# Altium schematic sheet Analog_Project_Mixer_output.SchDoc
size A4; SheetNumber: 1; SheetTotal: 1
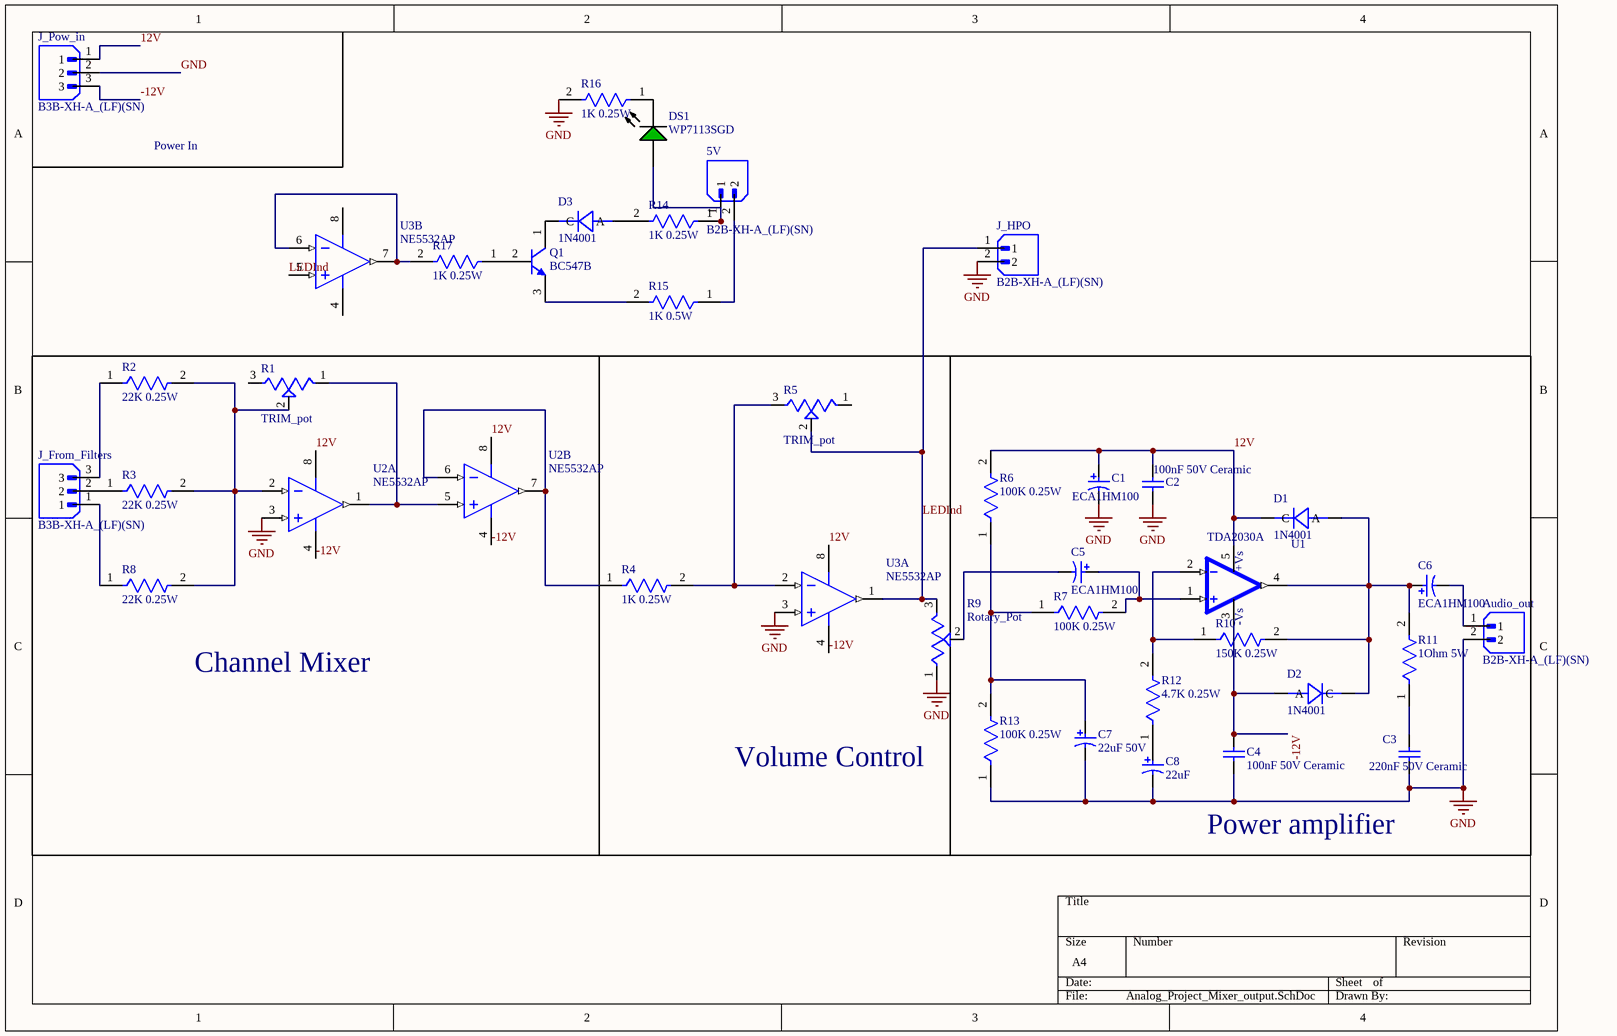
[diagram p0: Analog_Project_Mixer_output.SchDoc]

## Parts
5V  B2B-XH-A_(LF)(SN)  [JST_B2B-XH-A_(LF)(SN)]
Audio_out  B2B-XH-A_(LF)(SN)  [JST_B2B-XH-A_(LF)(SN)]
C1  ECA1HM100  [10uF 25V]
C2  100nF 50V Ceramic  [100nF Cap]
C3  220nF 50V Ceramic  [100nF Cap]
C4  100nF 50V Ceramic  [100nF Cap]
C5  ECA1HM100  [10uF 25V]
C6  ECA1HM100  [10uF 25V]
C7  22uF 50V  [10uF 25V]
C8  22uF  [10uF 25V]
D1  1N4001  [1N400X]
D2  1N4001  [1N400X]
D3  1N4001  [1N400X]
DS1  WP7113SGD  [KING-WP7113SGD_V]
J_From_Filters  B3B-XH-A_(LF)(SN)  [JST_B3B-XH-A (LF)(SN)]
J_HPO  B2B-XH-A_(LF)(SN)  [JST_B2B-XH-A_(LF)(SN)]
J_Pow_in  B3B-XH-A_(LF)(SN)  [JST_B3B-XH-A (LF)(SN)]
Q1  BC547B  [BC547B]
R1  TRIM_pot  [TRIM_Pot]
R2  22K 0.25W  [0.25W Carbon film]
R3  22K 0.25W  [0.25W Carbon film]
R4  1K 0.25W  [0.50W Carbon film]
R5  TRIM_pot  [TRIM_Pot]
R6  100K 0.25W  [0.25W Carbon film]
R7  100K 0.25W  [0.25W Carbon film]
R8  22K 0.25W  [0.25W Carbon film]
R9  Rotary_Pot  [Rotary_pot]
R10  150K 0.25W  [0.25W Carbon film]
R11  1Ohm 5W  [0.5W resistor]
R12  4.7K 0.25W  [0.50W Carbon film]
R13  100K 0.25W  [0.25W Carbon film]
R14  1K 0.25W  [0.25W Carbon film]
R15  1K 0.5W  [0.25W Carbon film]
R16  1K 0.25W  [0.25W Carbon film]
R17  1K 0.25W  [0.25W Carbon film]
U1  TDA2030A  [TDA2030A]
U2  NE5532AP  [NE5532]  (parts A,B of 2)
U3  NE5532AP  [NE5532]  (parts A,B of 2)

## Nets
GND: Audio_out.2 C1.2 C2.1 C3.1 C4.1 C7.2 C8.2 J_HPO.2 J_Pow_in.2 R9.1 R13.1 R16.2 U2.3(IN1+) U3.3(IN1+)
12V: C1.1 C2.2 D1.C J_Pow_in.1 R6.2 U1.5(+VS) U2.8(VCC+) U3.8(VCC+)
-12V: C4.2 D2.A J_Pow_in.3 U1.3(-VS) U2.4(VCC-) U3.4(VCC-)
LEDInd: J_HPO.1 R5.2(W) R9.3 U3.1(OUT1) U3.5(IN2+)
Net5V_1: 5V.1 DS1.1(A) R14.1
Net5V_2: 5V.2 R15.1
NetAudio_out_1: Audio_out.1 C6.2
NetC3_2: C3.2 R11.1
NetC5_1: C5.1 R7.2 U1.1(NON_INV_IN)
NetC5_2: C5.2 R9.2
NetC6_1: C6.1 D1.A D2.C R10.2 R11.2 U1.4(OUT)
NetC7_1: C7.1 R6.1 R7.1 R13.2
NetC8_1: C8.1 R12.1
NetD3_A: D3.A R14.2
NetD3_C: D3.C Q1.1(C)
NetDS1_2: DS1.2(K) R16.1
NetJ_From_Filters_1: J_From_Filters.1 R8.1
NetJ_From_Filters_2: J_From_Filters.2 R3.1
NetJ_From_Filters_3: J_From_Filters.3 R2.1
NetQ1_2: Q1.2(B) R17.1
NetQ1_3: Q1.3(E) R15.2
NetR1_1: R1.1(CCW) U2.1(OUT1) U2.5(IN2+)
NetR1_2: R1.2(W) R2.2 R3.2 R8.2 U2.2(IN1-)
NetR4_1: R4.1 U2.6(IN2-) U2.7(OUT2)
NetR4_2: R4.2 R5.3(CW) U3.2(IN1-)
NetR10_1: R10.1 R12.2 U1.2(INV_IN)
NetR17_2: R17.2 U3.6(IN2-) U3.7(OUT2)

Not connected (* = marked no-connect by the designer): R1 3(CW); R5 1(CCW)

## Notes on the sheet
- Power In
- Channel Mixer
- Volume Control
- Power amplifier
- (in symbol TDA2030A) +Vs; -Vs

## Library data of the parts
5V Audio_out J_HPO = B2B-XH-A_(LF)(SN): Connector Header Through Hole 2 position 0.098 (2.50mm); MF: JST Sales; MP: B2B-XH-A (LF)(SN); SnapEDA_Link: https://www.snapeda.com/parts/B2B-XH-A%20(LF)(SN)/JST+Sales+America+Inc./view-part/?ref=snap; Package: None; Value: *; Check_prices: https://www.snapeda.com/parts/B2B-XH-A%20(LF)(SN)/JST+Sales+America+Inc./view-part/?ref=eda
C1 = 100uF 25V: Aluminum Electrolytic Capacitor, 10 uF, +/- 20%, 50 V, -40 to 85 degC, 2-Pin THD, RoHS, Bulk; Manufacturer: Panasonic; Life (Hours): 2000Hour; Lead/Base Style: Straight; Dissipation Factor: 0.12%; Capacitance: 10uF; Leakage Current: 3uA; Dielectric Material: Aluminium; Lead Diameter: 0.5mm; Voltage Rating: 50V; Ripple Current: 65mA; Package Reference: CAPPR55-200-1100X500X1200; Height: 11mm; Diameter: 5mm; REACH SVHC: NoSVHC; Mount: ThroughHole; Packaging: Bulk; Manufacturer URL: http://www.panasonic.com/; Termination: Radial; Datasheet URL: https://industrial.panasonic.com/cdbs/www-data/pdf/RDF0000/ABA0000C1218.pdf; Lead Free: LeadFree; Height - Seated (Max): 0.472inch; Case/Package: Radial; Package Description: 2-Pin Radial Lead, Dia 5 mm, Height 12 mm; Tolerance: 20%; Datasheet Version: Rev. 05, 10/2016; Package Quantity: 200; Ripple Current (AC): 65mA; Min Operating Temperature: -40degC; RoHSCompliant: true; Number of Pins: 2; Max Operating Temperature: 85degC; Voltage: 50V; Lead Pitch: 2mm; Radiation Hardening: No; Voltage Rating (DC): 50V; Length: 11mm
C2 C4 = 100nF 50V Ceramic: Ceramic Capacitor, 100 nF, +/- 10%, 50 V, -55 to 125 degC, 2-Pin THD, RoHS, Tape and Reel; Manufacturer: Vishay; Other Names: BC1084CT; Catalog Drawings: Mono-KapSide2-15_5.58Mono-KapSide1_15; Temperature Coefficient: X7R; Online Catalog: Mono-Kap™Series; Capacitance: 0.1µF; Size / Dimension: 0.157"Lx0.098"W(4.00mmx2.50mm); Operating Temperature: -55°C~125°C; Family: CeramicCapacitors; Manufacturer URL: http://www.vishay.com/; Standard Package: 1; Thickness (Max): -; Ratings: -; Datasheet Version: 08/2013; Package Description: 2-Pin Through Hole Device, Body 4 x 2.6 mm; Mounting Type: ThroughHole; Features: -; Lead Spacing: 0.098"(2.50mm); Tolerance: ±10%; Category: Capacitors; Mounting Technology: ThroughHole; Voltage - Rated: 50V; Lead Style: Straight; Datasheet URL: http://www.vishay.com/docs/45171/kseries.pdf; Applications: GeneralPurpose; Package / Case: Radial; Height - Seated (Max): 0.220"(5.58mm); Package Reference: K104K15X7RF5TL2; Series: Mono-Kap™K; Packaging: CutTape(CT)
C3 = 220nF 50V Ceramic: Ceramic Capacitor, 100 nF, +/- 10%, 50 V, -55 to 125 degC, 2-Pin THD, RoHS, Tape and Reel; Manufacturer: Vishay; Other Names: BC1084CT; Catalog Drawings: Mono-KapSide2-15_5.58Mono-KapSide1_15; Temperature Coefficient: X7R; Online Catalog: Mono-Kap™Series; Capacitance: 0.1µF; Size / Dimension: 0.157"Lx0.098"W(4.00mmx2.50mm); Operating Temperature: -55°C~125°C; Family: CeramicCapacitors; Manufacturer URL: http://www.vishay.com/; Standard Package: 1; Thickness (Max): -; Ratings: -; Datasheet Version: 08/2013; Package Description: 2-Pin Through Hole Device, Body 4 x 2.6 mm; Mounting Type: ThroughHole; Features: -; Lead Spacing: 0.098"(2.50mm); Tolerance: ±10%; Category: Capacitors; Mounting Technology: ThroughHole; Voltage - Rated: 50V; Lead Style: Straight; Datasheet URL: http://www.vishay.com/docs/45171/kseries.pdf; Applications: GeneralPurpose; Package / Case: Radial; Height - Seated (Max): 0.220"(5.58mm); Package Reference: K104K15X7RF5TL2; Series: Mono-Kap™K; Packaging: CutTape(CT)
C5 = 1uF 50v electrolytic: Aluminum Electrolytic Capacitor, 10 uF, +/- 20%, 50 V, -40 to 85 degC, 2-Pin THD, RoHS, Bulk; Manufacturer: Panasonic; Life (Hours): 2000Hour; Lead/Base Style: Straight; Dissipation Factor: 0.12%; Capacitance: 10uF; Leakage Current: 3uA; Dielectric Material: Aluminium; Lead Diameter: 0.5mm; Voltage Rating: 50V; Ripple Current: 65mA; Package Reference: CAPPR55-200-1100X500X1200; Height: 11mm; Diameter: 5mm; REACH SVHC: NoSVHC; Mount: ThroughHole; Packaging: Bulk; Manufacturer URL: http://www.panasonic.com/; Termination: Radial; Datasheet URL: https://industrial.panasonic.com/cdbs/www-data/pdf/RDF0000/ABA0000C1218.pdf; Lead Free: LeadFree; Height - Seated (Max): 0.472inch; Case/Package: Radial; Package Description: 2-Pin Radial Lead, Dia 5 mm, Height 12 mm; Tolerance: 20%; Datasheet Version: Rev. 05, 10/2016; Package Quantity: 200; Ripple Current (AC): 65mA; Min Operating Temperature: -40degC; RoHSCompliant: true; Number of Pins: 2; Max Operating Temperature: 85degC; Voltage: 50V; Lead Pitch: 2mm; Radiation Hardening: No; Voltage Rating (DC): 50V; Length: 11mm
C6 = 2000uF 25V: Aluminum Electrolytic Capacitor, 10 uF, +/- 20%, 50 V, -40 to 85 degC, 2-Pin THD, RoHS, Bulk; Manufacturer: Panasonic; Life (Hours): 2000Hour; Lead/Base Style: Straight; Dissipation Factor: 0.12%; Capacitance: 10uF; Leakage Current: 3uA; Dielectric Material: Aluminium; Lead Diameter: 0.5mm; Voltage Rating: 50V; Ripple Current: 65mA; Package Reference: CAPPR55-200-1100X500X1200; Height: 11mm; Diameter: 5mm; REACH SVHC: NoSVHC; Mount: ThroughHole; Packaging: Bulk; Manufacturer URL: http://www.panasonic.com/; Termination: Radial; Datasheet URL: https://industrial.panasonic.com/cdbs/www-data/pdf/RDF0000/ABA0000C1218.pdf; Lead Free: LeadFree; Height - Seated (Max): 0.472inch; Case/Package: Radial; Package Description: 2-Pin Radial Lead, Dia 5 mm, Height 12 mm; Tolerance: 20%; Datasheet Version: Rev. 05, 10/2016; Package Quantity: 200; Ripple Current (AC): 65mA; Min Operating Temperature: -40degC; RoHSCompliant: true; Number of Pins: 2; Max Operating Temperature: 85degC; Voltage: 50V; Lead Pitch: 2mm; Radiation Hardening: No; Voltage Rating (DC): 50V; Length: 11mm
C7 = 22uF 50V: Aluminum Electrolytic Capacitor, 10 uF, +/- 20%, 50 V, -40 to 85 degC, 2-Pin THD, RoHS, Bulk; Manufacturer: Panasonic; Life (Hours): 2000Hour; Lead/Base Style: Straight; Dissipation Factor: 0.12%; Capacitance: 10uF; Leakage Current: 3uA; Dielectric Material: Aluminium; Lead Diameter: 0.5mm; Ripple Current: 65mA; Package Reference: CAPPR55-200-1100X500X1200; Height: 11mm; Diameter: 5mm; REACH SVHC: NoSVHC; Mount: ThroughHole; Packaging: Bulk; Manufacturer URL: http://www.panasonic.com/; Termination: Radial; Datasheet URL: https://industrial.panasonic.com/cdbs/www-data/pdf/RDF0000/ABA0000C1218.pdf; Lead Free: LeadFree; Height - Seated (Max): 0.472inch; Case/Package: Radial; Package Description: 2-Pin Radial Lead, Dia 5 mm, Height 12 mm; Tolerance: 20%; Voltage Rating: 50V; Datasheet Version: Rev. 05, 10/2016; Package Quantity: 200; Ripple Current (AC): 65mA; Min Operating Temperature: -40degC; RoHSCompliant: true; Number of Pins: 2; Max Operating Temperature: 85degC; Voltage: 50V; Lead Pitch: 2mm; Radiation Hardening: No; Voltage Rating (DC): 50V; Length: 11mm
C8 = 2.2uF 50V: Aluminum Electrolytic Capacitor, 10 uF, +/- 20%, 50 V, -40 to 85 degC, 2-Pin THD, RoHS, Bulk; Manufacturer: Panasonic; Life (Hours): 2000Hour; Lead/Base Style: Straight; Dissipation Factor: 0.12%; Capacitance: 10uF; Leakage Current: 3uA; Dielectric Material: Aluminium; Lead Diameter: 0.5mm; Voltage Rating: 50V; Ripple Current: 65mA; Package Reference: CAPPR55-200-1100X500X1200; Height: 11mm; Diameter: 5mm; REACH SVHC: NoSVHC; Mount: ThroughHole; Packaging: Bulk; Manufacturer URL: http://www.panasonic.com/; Termination: Radial; Datasheet URL: https://industrial.panasonic.com/cdbs/www-data/pdf/RDF0000/ABA0000C1218.pdf; Lead Free: LeadFree; Height - Seated (Max): 0.472inch; Case/Package: Radial; Package Description: 2-Pin Radial Lead, Dia 5 mm, Height 12 mm; Tolerance: 20%; Datasheet Version: Rev. 05, 10/2016; Package Quantity: 200; Ripple Current (AC): 65mA; Min Operating Temperature: -40degC; RoHSCompliant: true; Number of Pins: 2; Max Operating Temperature: 85degC; Voltage: 50V; Lead Pitch: 2mm; Radiation Hardening: No; Voltage Rating (DC): 50V; Length: 11mm
D1-D3 = 1N4001: DIODE, STANDARD, 1A, 50V, DO-204AL-2; Diode Type: Standard Recovery; Diode Config; Manufacturer: Vishay; Manufacturer Part Number: 1N4001-E3/73; MF: Vishay Semiconductor; MP: 1N4007E-E3/64; Element Configuration: Single; Forward Voltage: 1.1V; Max Forward Surge Current (Ifsm): 30A; Max Junction Temperature (Tj): 150°C; Number of Elements: 1; Peak Non-Repetitive Surge Current: 45A; Peak Reverse Current: 5µA; SnapEDA_Link: https://www.snapeda.com/parts/1N4007E-E3/64/Vishay/view-part/?ref=snap; Package: DO-41 Vishay Semiconductor; Value: *; Check_prices: https://www.snapeda.com/parts/1N4007E-E3/64/Vishay/view-part/?ref=eda; Supplier: DigiKey; Supplier Part Number: 1N4001-E3/73GICT-ND; RoHS: Compliant; Category: Rectifier Diodes; Stock: 29129; Pricing: 1=0.15, 10=0.101, 100=0.0827, 500=0.06926 (USD); Average Rectified Current: 1A; China RoHS: Non-Compliant; Contact Plating: Tin; Current: 1A; Forward Current: 1A; Height: 2.7mm; Length: 5.2mm; Lifecycle Status: Production; Max Operating Temperature: 150°C; Max Output current: 1A; Max Repetitive Reverse Voltage (Vrrm): 50V; Max Reverse Voltage (DC): 50V; Max Surge Current: 30A; Min Operating Temperature: -50°C; Mounting Technology: Through Hole; Pins: 2; Number of Terminals: 2; Radiation Hardening: No; REACH SVHC: No; Reverse Standoff Voltage: 50V; Reverse Voltage: 50V; Schedule B: 8541100080, 8541100080|8541100080|8541100080|8541100080|8541100080; Voltage: 50V; Width: 2.7mm; ComponentLink1URL: https://datasheet.octopart.com:443/1N4001-E3-73-Vishay-datasheet-168682104.pdf?src-supplier=Newark; ComponentLink1Description: https://datasheet.octopart.com:443/1N4001-E3-73-Vishay-datasheet-168682104.pdf?src-supplier=Newark; ComponentLink2URL: https://datasheet.octopart.com:443/1N4001-E3-73-Vishay-datasheet-11547366.pdf?src-supplier=Newark; ComponentLink2Description: https://datasheet.octopart.com:443/1N4001-E3-73-Vishay-datasheet-11547366.pdf?src-supplier=Newark; ComponentLink3URL: https://datasheet.octopart.com:443/1N4001-E3-73-Vishay-datasheet-8381009.pdf?src-supplier=Newark; ComponentLink3Description: https://datasheet.octopart.com:443/1N4001-E3-73-Vishay-datasheet-8381009.pdf?src-supplier=Newark; ComponentLink4URL: https://datasheet.octopart.com:443/1N4001-E3-73-Vishay-datasheet-519570.pdf?src-supplier=Newark; ComponentLink4Description: https://datasheet.octopart.com:443/1N4001-E3-73-Vishay-datasheet-519570.pdf?src-supplier=Newark; ComponentLink5URL: https://datasheet.octopart.com:443/1N4001-E3-73-Vishay-datasheet-41303593.pdf?src-supplier=Newark; ComponentLink5Description: https://datasheet.octopart.com:443/1N4001-E3-73-Vishay-datasheet-41303593.pdf?src-supplier=Newark; ComponentLink6URL: https://datasheet.octopart.com:443/1N4001-E3-73-Vishay-datasheet-62317716.pdf?src-supplier=element14+APAC; ComponentLink6Description: https://datasheet.octopart.com:443/1N4001-E3-73-Vishay-datasheet-62317716.pdf?src-supplier=element14+APAC; ComponentLink7URL: https://datasheet.octopart.com:443/1N4001-E3-73-Vishay-datasheet-41195573.pdf?src-supplier=Farnell; ComponentLink7Description: https://datasheet.octopart.com:443/1N4001-E3-73-Vishay-datasheet-41195573.pdf?src-supplier=Farnell; ComponentLink8URL: http://sigma.octopart.com:80/rohs_statement/Vishay-company-15.pdf?src-supplier=Compliance+Statements; ComponentLink8Description: http://sigma.octopart.com:80/rohs_statement/Vishay-company-15.pdf?src-supplier=Compliance+Statements
DS1 = CMP-007-00010-2: LED Green, 62.5 mW, 25 mA, -40 to 85 degC, 2-Pin THD, RoHS, Bulk; Manufacturer: Kingbright; Lens Style: Dome; Nominal Vf: 2.2V; Power: 62.5mW; Luminous Intensity: 40mcd; Viewing Angle: 30degrees; Datasheet URL: http://www.kingbrightusa.com/images/catalog/SPEC/WP7113SGD.pdf; Datasheet Version: Rev. 6B, 01/2015; Illumination Colour: Green; Package Quantity: 1000; Package Description: 2-Pin Through Hole Device, Dia 5.9 mm, Body Length 8.6 mm; Colour: Green; Case/Package: Radial; RoHS Compliant: True; Package Reference: WP7113SGD; Mounting Technology: TH; Packaging: Bulk; Forward Voltage: 2.2V
J_From_Filters J_Pow_in = B3B-XH-A_(LF)(SN): Connector Header Through Hole 3 position 0.098 (2.50mm); MF: JST Sales America Inc.; MP: B3B-XH-A (LF)(SN); SnapEDA_Link: https://www.snapeda.com/parts/B3B-XH-A%20(LF)(SN)/JST+Sales+America+Inc./view-part/?ref=snap; Package: None; Value: *; Check_prices: https://www.snapeda.com/parts/B3B-XH-A%20(LF)(SN)/JST+Sales+America+Inc./view-part/?ref=eda
Q1 = BC547B: BC547 Series 45 V CE Breakdown .1 A NPN Epitaxial Silicon Transistor - TO-92; Manufacturer: On Semiconductor; Manufacturer Lifecycle Status: ACTIVE; Manufacturer Package Identifier: MKT-ZA03DREV3; Packing: Bulk Box; IC Continuous (A): 0.1; fT Min (MHz): 150; Collector Base Voltage (VCBO): 50V; Collector Emitter Breakdown Voltage: 45V; Collector Emitter Saturation Voltage: 250mV; Current: 1A; Current Rating: 100mA; Element Configuration: Single; Emitter Base Voltage (VEBO): 6V; Frequency: 300MHz; Gain Bandwidth Product: 100MHz; hFE Min: 200; Max Power Dissipation: 625mW; Number of Elements: 1; Power Dissipation: 500mW; Voltage: 40V; DatasheetVersion: Rev. 7; ComponentLink1URL: http://www.onsemi.com/; Polarity: NPN; RoHS: FALSE; ComponentLink1Description: Manufacturer URL; PackageDescription: 3-Pin Transistor Outline, Body 4.825 x 3.685 mm, Pitch 1.27 mm; ComponentLink3URL: http://www.onsemi.cn/pub_link/Collateral/2N6426-D.PDF; ComponentLink2Description: Datasheet; PackageVersion: Rev. AM; PackageReference: TO-92-3-29-11_AM_SL; ComponentLink3Description: Package Specification; Mounting Technology: Through Hole; PartNumber: BC547B; ComponentLink2URL: http://www.onsemi.com/pub_link/Collateral/BC546-D.PDF; Supplier: DigiKey; Supplier Part Number: BC547BFS-ND; Manufacturer Part Number: BC547B; Category: BJTs; Stock: 6659; Pricing: 1=0.38, 10=0.234, 100=0.1472, 500=0.10944, 1000=0.09723, 2000=0.08693, 5000=0.07576, 10000=0.06884, 50000=0.05673 (USD); Case/Package: TO-92; China RoHS: Compliant; Collector Emitter Voltage (VCEO): 45V; Contact Plating: Copper, Silver, Tin; Height: 4.58mm; Lead Free: Lead Free; Length: 4.58mm; Lifecycle Status: Production; Max Breakdown Voltage: 45V; Max Collector Current: 100mA; Clock Frequency: 300MHz; Max Operating Temperature: 150°C; Min Operating Temperature: -65°C; Pins: 3; Number of Terminals: 3; Packaging: Bulk; Radiation Hardening: No; REACH SVHC: Yes; Transition Frequency: 300MHz; Voltage Rating (DC): 45V; Weight: 200.005886mg; Width: 3.86mm; ComponentLink4URL: https://datasheet.octopart.com:443/BC547B-onsemi-datasheet-180957945.pdf?src-supplier=IHS; ComponentLink4Description: https://datasheet.octopart.com:443/BC547B-onsemi-datasheet-180957945.pdf?src-supplier=IHS; ComponentLink5URL: https://datasheet.octopart.com:443/BC547B-Fairchild-Semiconductor-datasheet-34208604.pdf?src-supplier=IHS; ComponentLink5Description: https://datasheet.octopart.com:443/BC547B-Fairchild-Semiconductor-datasheet-34208604.pdf?src-supplier=IHS; ComponentLink6URL: https://datasheet.octopart.com:443/BC547B-ON-Semiconductor-datasheet-11548122.pdf?src-supplier=Master+Electronics; ComponentLink6Description: https://datasheet.octopart.com:443/BC547B-ON-Semiconductor-datasheet-11548122.pdf?src-supplier=Master+Electronics; ComponentLink7URL: https://datasheet.octopart.com:443/BC547B-ON-Semiconductor-datasheet-26353630.pdf?src-supplier=Upverter; ComponentLink7Description: https://datasheet.octopart.com:443/BC547B-ON-Semiconductor-datasheet-26353630.pdf?src-supplier=Upverter; ComponentLink8URL: https://datasheet.octopart.com:443/BC547B-ON-Semiconductor-datasheet-574670.pdf?src-supplier=onsemi; ComponentLink8Description: https://datasheet.octopart.com:443/BC547B-ON-Semiconductor-datasheet-574670.pdf?src-supplier=onsemi; ComponentLink9URL: https://datasheet.octopart.com:443/BC547B-ON-Semiconductor-datasheet-151678557.pdf?src-supplier=onsemi; ComponentLink9Description: https://datasheet.octopart.com:443/BC547B-ON-Semiconductor-datasheet-151678557.pdf?src-supplier=onsemi; ComponentLink10URL: https://datasheet.octopart.com:443/BC547B-ON-Semiconductor-datasheet-86688575.pdf?src-supplier=onsemi; ComponentLink10Description: https://datasheet.octopart.com:443/BC547B-ON-Semiconductor-datasheet-86688575.pdf?src-supplier=onsemi; ComponentLink11URL: https://datasheet.octopart.com:443/BC547B-Fairchild-datasheet-7074.pdf?src-supplier=Fairchild+Semiconductor; ComponentLink11Description: https://datasheet.octopart.com:443/BC547B-Fairchild-datasheet-7074.pdf?src-supplier=Fairchild+Semiconductor; ComponentLink12URL: https://sigma.octopart.com:443/8329026/technical_drawing/Fairchild-Semiconductor-BC547B.pdf?src-supplier=Fairchild+Semiconductor; ComponentLink12Description: https://sigma.octopart.com:443/8329026/technical_drawing/Fairchild-Semiconductor-BC547B.pdf?src-supplier=Fairchild+Semiconductor; ComponentLink13URL: https://datasheet.octopart.com:443/BC547B-ON-Semiconductor-datasheet-105062517.pdf?src-supplier=Future+Electronics; ComponentLink13Description: https://datasheet.octopart.com:443/BC547B-ON-Semiconductor-datasheet-105062517.pdf?src-supplier=Future+Electronics; ComponentLink14URL: https://datasheet.octopart.com:443/BC547B-ON-Semiconductor-datasheet-86684081.pdf?src-supplier=element14+APAC; ComponentLink14Description: https://datasheet.octopart.com:443/BC547B-ON-Semiconductor-datasheet-86684081.pdf?src-supplier=element14+APAC; ComponentLink15URL: https://datasheet.octopart.com:443/BC547B-Fairchild-Semiconductor-datasheet-7537324.pdf?src-supplier=Farnell; ComponentLink15Description: https://datasheet.octopart.com:443/BC547B-Fairchild-Semiconductor-datasheet-7537324.pdf?src-supplier=Farnell; ComponentLink16URL: https://datasheet.octopart.com:443/BC547B-Fairchild-Semiconductor-datasheet-637514.pdf?src-supplier=Farnell; ComponentLink16Description: https://datasheet.octopart.com:443/BC547B-Fairchild-Semiconductor-datasheet-637514.pdf?src-supplier=Farnell; ComponentLink17URL: https://datasheet.octopart.com:443/BC547B-ON-Semiconductor-datasheet-6055.pdf?src-supplier=DigiKey; ComponentLink17Description: https://datasheet.octopart.com:443/BC547B-ON-Semiconductor-datasheet-6055.pdf?src-supplier=DigiKey; ComponentLink18URL: https://datasheet.octopart.com:443/BC547B-Fairchild-Semiconductor-datasheet-67878763.pdf?src-supplier=Newark; ComponentLink18Description: https://datasheet.octopart.com:443/BC547B-Fairchild-Semiconductor-datasheet-67878763.pdf?src-supplier=Newark; ComponentLink19URL: https://datasheet.octopart.com:443/BC547B-Fairchild-Semiconductor-datasheet-78861862.pdf?src-supplier=Newark; ComponentLink19Description: https://datasheet.octopart.com:443/BC547B-Fairchild-Semiconductor-datasheet-78861862.pdf?src-supplier=Newark; ComponentLink20URL: http://sigma.octopart.com:80/150605340/rohs_statement/ON-Semiconductor-BC547B.pdf?src-supplier=Compliance+Statements; ComponentLink20Description: http://sigma.octopart.com:80/150605340/rohs_statement/ON-Semiconductor-BC547B.pdf?src-supplier=Compliance+Statements; ComponentLink21URL: http://sigma.octopart.com:80/23426736/rohs_statement/Fairchild-Semiconductor-BC547B.pdf?src-supplier=Compliance+Statements; ComponentLink21Description: http://sigma.octopart.com:80/23426736/rohs_statement/Fairchild-Semiconductor-BC547B.pdf?src-supplier=Compliance+Statements; ComponentLink22URL: http://sigma.octopart.com:80/23426737/materials_sheet/Fairchild-Semiconductor-BC547B.pdf?src-supplier=Compliance+Statements; ComponentLink22Description: http://sigma.octopart.com:80/23426737/materials_sheet/Fairchild-Semiconductor-BC547B.pdf?src-supplier=Compliance+Statements; ComponentLink23URL: http://sigma.octopart.com:80/33052967/reach_statement/Fairchild-Semiconductor-BC547B.pdf?src-supplier=Compliance+Statements; ComponentLink23Description: http://sigma.octopart.com:80/33052967/reach_statement/Fairchild-Semiconductor-BC547B.pdf?src-supplier=Compliance+Statements; ComponentLink24URL: http://sigma.octopart.com:80/33053049/materials_sheet/Fairchild-Semiconductor-BC547B.pdf?src-supplier=Compliance+Statements; ComponentLink24Description: http://sigma.octopart.com:80/33053049/materials_sheet/Fairchild-Semiconductor-BC547B.pdf?src-supplier=Compliance+Statements; ComponentLink25URL: http://sigma.octopart.com:80/reach_statement/ON-Semiconductor-company-79.pdf?src-supplier=Compliance+Statements; ComponentLink25Description: http://sigma.octopart.com:80/reach_statement/ON-Semiconductor-company-79.pdf?src-supplier=Compliance+Statements; ComponentLink26URL: http://sigma.octopart.com:80/rohs_statement/Fairchild-Semiconductor-company-11.pdf?src-supplier=Compliance+Statements; ComponentLink26Description: http://sigma.octopart.com:80/rohs_statement/Fairchild-Semiconductor-company-11.pdf?src-supplier=Compliance+Statements; ComponentLink27URL: http://sigma.octopart.com:80/rohs_statement/Fairchild-Semiconductor-company-10.pdf?src-supplier=Compliance+Statements; ComponentLink27Description: http://sigma.octopart.com:80/rohs_statement/Fairchild-Semiconductor-company-10.pdf?src-supplier=Compliance+Statements; ComponentLink28URL: http://sigma.octopart.com:80/reach_statement/Fairchild-Semiconductor-company-9.pdf?src-supplier=Compliance+Statements; ComponentLink28Description: http://sigma.octopart.com:80/reach_statement/Fairchild-Semiconductor-company-9.pdf?src-supplier=Compliance+Statements; ComponentLink29URL: https://octopart.com:443/opatz8j6/c1?t=Wh0HLASlSBeZaUiz3GayB3OWGMt4DmM6z_ZHtko5fz1ybrcnR6Q5ICyIXUvgUGErCw6SavT9HUoF3FtEPIgT2pvj8H4VDy6Hd6AutYjKCWRDmj_avBiiD6MDUQmCYL58rHETmzfTDop89euoDPYG6n7EpgAR1EK3peF7mSphNTJXxp5tzGfvJXgXxfT9ZK4QqXLLKUAGmSHxm0lcR-ipPWnbnyTSZFp2lUUaaeJmZTWgQRT_ULvLk_dzj5KOmkpKoSPCuaKPqYqmAx_zP3CUHOEPTgvu2NcgXvP0ixksM_8BtOyVVK_YA_YYSP8TmFX2wgVu4HOJ81tq2U284no1t_dGaXacBRgQ&src-supplier=Compliance+Statements; ComponentLink29Description: https://octopart.com:443/opatz8j6/c1?t=Wh0HLASlSBeZaUiz3GayB3OWGMt4DmM6z_ZHtko5fz1ybrcnR6Q5ICyIXUvgUGErCw6SavT9HUoF3FtEPIgT2pvj8H4VDy6Hd6AutYjKCWRDmj_avBiiD6MDUQmCYL58rHETmzfTDop89euoDPYG6n7EpgAR1EK3peF7mSphNTJXxp5tzGfvJXgXxfT9ZK4QqXLLKUAGmSHxm0lcR-ipPWnbnyTSZFp2lUUaaeJmZTWgQRT_ULvLk_dzj5KOmkpKoSPCuaKPqYqmAx_zP3CUHOEPTgvu2NcgXvP0ixksM_8BtOyVVK_YA_YYSP8TmFX2wgVu4HOJ81tq2U284no1t_dGaXacBRgQ&src-supplier=Compliance+Statements; ComponentLink30URL: https://octopart.com:443/opatz8j6/c1?t=da9r1jQd4zQjw_w6ZlLw14OT-Olb6rZnis77aO1bwvVJE9VZLxP6k91EfUxso6SyEwgc3mQHYqgqdzaIBeeuW6l6C_PMd9OWXk0hzlafdbDo9oRHF78bObiDlVopW-MpZGN62L_bqtt5v3wnCVRPCsoOPixPbBBS4UuAheGlixJp5OmgHHax5z3G59s1jVXQoRaabBS0w2aQZyxUe6oqNMDLdkAlYBf0kYt772jkopSlA7hHQqKSeeywQR1QCbJX8_FT8PJ-KGPUcpOn56JQWBh67x6J5z68Z1FSgYjIuPfF-N0YtkThmqYJeUavB1H-_6-x659USCRP7rJ3bZDcPIEc1AdHEuc&src-supplier=Compliance+Statements; ComponentLink30Description: https://octopart.com:443/opatz8j6/c1?t=da9r1jQd4zQjw_w6ZlLw14OT-Olb6rZnis77aO1bwvVJE9VZLxP6k91EfUxso6SyEwgc3mQHYqgqdzaIBeeuW6l6C_PMd9OWXk0hzlafdbDo9oRHF78bObiDlVopW-MpZGN62L_bqtt5v3wnCVRPCsoOPixPbBBS4UuAheGlixJp5OmgHHax5z3G59s1jVXQoRaabBS0w2aQZyxUe6oqNMDLdkAlYBf0kYt772jkopSlA7hHQqKSeeywQR1QCbJX8_FT8PJ-KGPUcpOn56JQWBh67x6J5z68Z1FSgYjIuPfF-N0YtkThmqYJeUavB1H-_6-x659USCRP7rJ3bZDcPIEc1AdHEuc&src-supplier=Compliance+Statements
R1 R5 = TRIM_pot: TRIMMER - 6MM ROUND, SINGLE-TURN,CERMET, 10K OHMS | Bourns 3306F-1-103; SnapEDA_Link: https://www.snapeda.com/parts/3306F-1-103/Bourns/view-part/?ref=snap; Package: 3306F Bourns; Value: *; MF: Bourns; MP: 3306F-1-103; Check_prices: https://www.snapeda.com/parts/3306F-1-103/Bourns/view-part/?ref=eda
R4 R14 R16 R17 = 1K 0.25W: Fixed Resistor, Metal Film, 0.25W, 1000ohm, 250V, 1% +/-Tol, 100ppm/Cel, Through Hole Mount; Manufacturer: Yageo Group; Manufacturer Part Number: MFR-25FBF52-1K; Lead Diameter: 550µm; Lead Length: 28mm; Max Power Dissipation: 250mW; Value: 1kΩ; Temperature Coefficient: 100ppm/°C; Voltage Rating (DC): 200V; Supplier: Avnet; Supplier Part Number: MFR-25FBF52-1K; RoHS: Compliant; Category: Through-Hole Resistors; Stock: 714; Pricing: 1=0.00766, 10=0.00745, 30=0.00726, 50=0.00713, 100=0.00696 (USD); Case/Package: Axial; China RoHS: Compliant; Composition: Metal Film; Diameter: 2.4mm; Lead Free: Lead Free; Length: 6.2992mm; Lifecycle Status: Production; Max Operating Temperature: 155°C; Min Operating Temperature: -55°C; Mounting Technology: Through Hole; Pins: 2; Number of Terminals: 2; Number of Terminations: 2; Packaging: Bulk; Power Dissipation: 250mW; Power Rating: 250mW; REACH SVHC: Yes; Schedule B: 8533210090, 8533210090|8533210090|8533210090|8533210090|8533210090|8533210090|8533210090|8533210090|8533210090|8533210090|8533210090|8533210090|8533210090|8533210090|8533210090|8533210090|8533210090|8533210090|8533210090|8533210090|8533210090|8533210090|8533210090|85; Termination: Axial; Tolerance: 1%; Voltage Rating: 250V; Width: 6.3mm; Working Voltage: 250V; ComponentLink1URL: https://datasheet.octopart.com:443/MFR-25FBF52-1K-Yageo-datasheet-175665672.pdf?src-supplier=IHS; ComponentLink1Description: https://datasheet.octopart.com:443/MFR-25FBF52-1K-Yageo-datasheet-175665672.pdf?src-supplier=IHS; ComponentLink2URL: https://datasheet.octopart.com/MFR-25FBF52-1K-Yageo-datasheet-28066692.pdf; ComponentLink2Description: https://datasheet.octopart.com/MFR-25FBF52-1K-Yageo-datasheet-28066692.pdf; ComponentLink3URL: https://datasheet.octopart.com:443/MFR-25FBF52-1K-Yageo-datasheet-12510115.pdf?src-supplier=Upverter; ComponentLink3Description: https://datasheet.octopart.com:443/MFR-25FBF52-1K-Yageo-datasheet-12510115.pdf?src-supplier=Upverter; ComponentLink4URL: https://datasheet.octopart.com:443/MFR-25FBF52-1K-Yageo-datasheet-165493774.pdf?src-supplier=Future+Electronics; ComponentLink4Description: https://datasheet.octopart.com:443/MFR-25FBF52-1K-Yageo-datasheet-165493774.pdf?src-supplier=Future+Electronics; ComponentLink5URL: https://datasheet.octopart.com:443/MFR-25FBF52-1K-Yageo-datasheet-155367622.pdf?src-supplier=Future+Electronics; ComponentLink5Description: https://datasheet.octopart.com:443/MFR-25FBF52-1K-Yageo-datasheet-155367622.pdf?src-supplier=Future+Electronics; ComponentLink6URL: https://datasheet.octopart.com:443/MFR-25FBF52-1K-Yageo-datasheet-17233670.pdf?src-supplier=Future+Electronics; ComponentLink6Description: https://datasheet.octopart.com:443/MFR-25FBF52-1K-Yageo-datasheet-17233670.pdf?src-supplier=Future+Electronics; ComponentLink7URL: https://datasheet.octopart.com:443/MFR-25FBF52-1K-Yageo-datasheet-137700554.pdf?src-supplier=Future+Electronics; ComponentLink7Description: https://datasheet.octopart.com:443/MFR-25FBF52-1K-Yageo-datasheet-137700554.pdf?src-supplier=Future+Electronics; ComponentLink8URL: http://sigma.octopart.com:80/conflict_mineral_statement/Yageo-company-3.pdf?src-supplier=Compliance+Statements; ComponentLink8Description: http://sigma.octopart.com:80/conflict_mineral_statement/Yageo-company-3.pdf?src-supplier=Compliance+Statements; ComponentLink9URL: http://sigma.octopart.com:80/rohs_statement/Yageo-company-2.pdf?src-supplier=Compliance+Statements; ComponentLink9Description: http://sigma.octopart.com:80/rohs_statement/Yageo-company-2.pdf?src-supplier=Compliance+Statements
R9 = Rotary_Pot: 16.5 mm, Horizontal, Linear, 50 kÎ©, Through Hole, Knurled Shaft Single Section Rotary Potentiometer; MF: Same Sky; MP: PTN16-A50220K1B1; SnapEDA_Link: https://www.snapeda.com/parts/PTN16-A50220K1B1/Same+Sky/view-part/?ref=snap; Package: Package; Value: *; Check_prices: https://www.snapeda.com/parts/PTN16-A50220K1B1/Same+Sky/view-part/?ref=eda
R11 = 0.5W Resistor: RES 1.2M OHM 5% 1/2W AXIAL; Voltage Rating: 3.5kV; Power Rating: 500mW; Temperature Coefficient: 200ppm/°C; Resistance: 1.2MR; Diameter: 4mm; Max Operating Temperature: 155°C; Military Standard: Not; Reach SVHC Compliant: Yes; Min Operating Temperature: -55°C; Resistance Tolerance: 5%; Resistor Type: Metal Film; Tolerance: 5%; Mount: Through Hole; Construction: Cylindrical; Contact Plating: Tin; Length: 10mm; Termination: Axial; Voltage Rating (DC): 3.5kV; Packaging: Ammo Pack; Radiation Hardening: No; Case/Package: Conformal
R15 = 1K 0.5W: Fixed Resistor, Metal Film, 0.25W, 1000ohm, 250V, 1% +/-Tol, 100ppm/Cel, Through Hole Mount; Manufacturer: Yageo Group; Manufacturer Part Number: MFR-25FBF52-1K; Lead Diameter: 550µm; Lead Length: 28mm; Max Power Dissipation: 250mW; Value: 1kΩ; Temperature Coefficient: 100ppm/°C; Voltage Rating (DC): 200V; Supplier: Avnet; Supplier Part Number: MFR-25FBF52-1K; RoHS: Compliant; Category: Through-Hole Resistors; Stock: 714; Pricing: 1=0.00766, 10=0.00745, 30=0.00726, 50=0.00713, 100=0.00696 (USD); Case/Package: Axial; China RoHS: Compliant; Composition: Metal Film; Diameter: 2.4mm; Lead Free: Lead Free; Length: 6.2992mm; Lifecycle Status: Production; Max Operating Temperature: 155°C; Min Operating Temperature: -55°C; Mounting Technology: Through Hole; Pins: 2; Number of Terminals: 2; Number of Terminations: 2; Packaging: Bulk; Power Dissipation: 250mW; Power Rating: 250mW; REACH SVHC: Yes; Schedule B: 8533210090, 8533210090|8533210090|8533210090|8533210090|8533210090|8533210090|8533210090|8533210090|8533210090|8533210090|8533210090|8533210090|8533210090|8533210090|8533210090|8533210090|8533210090|8533210090|8533210090|8533210090|8533210090|8533210090|8533210090|85; Termination: Axial; Tolerance: 1%; Voltage Rating: 250V; Width: 6.3mm; Working Voltage: 250V; ComponentLink1URL: https://datasheet.octopart.com:443/MFR-25FBF52-1K-Yageo-datasheet-175665672.pdf?src-supplier=IHS; ComponentLink1Description: https://datasheet.octopart.com:443/MFR-25FBF52-1K-Yageo-datasheet-175665672.pdf?src-supplier=IHS; ComponentLink2URL: https://datasheet.octopart.com/MFR-25FBF52-1K-Yageo-datasheet-28066692.pdf; ComponentLink2Description: https://datasheet.octopart.com/MFR-25FBF52-1K-Yageo-datasheet-28066692.pdf; ComponentLink3URL: https://datasheet.octopart.com:443/MFR-25FBF52-1K-Yageo-datasheet-12510115.pdf?src-supplier=Upverter; ComponentLink3Description: https://datasheet.octopart.com:443/MFR-25FBF52-1K-Yageo-datasheet-12510115.pdf?src-supplier=Upverter; ComponentLink4URL: https://datasheet.octopart.com:443/MFR-25FBF52-1K-Yageo-datasheet-165493774.pdf?src-supplier=Future+Electronics; ComponentLink4Description: https://datasheet.octopart.com:443/MFR-25FBF52-1K-Yageo-datasheet-165493774.pdf?src-supplier=Future+Electronics; ComponentLink5URL: https://datasheet.octopart.com:443/MFR-25FBF52-1K-Yageo-datasheet-155367622.pdf?src-supplier=Future+Electronics; ComponentLink5Description: https://datasheet.octopart.com:443/MFR-25FBF52-1K-Yageo-datasheet-155367622.pdf?src-supplier=Future+Electronics; ComponentLink6URL: https://datasheet.octopart.com:443/MFR-25FBF52-1K-Yageo-datasheet-17233670.pdf?src-supplier=Future+Electronics; ComponentLink6Description: https://datasheet.octopart.com:443/MFR-25FBF52-1K-Yageo-datasheet-17233670.pdf?src-supplier=Future+Electronics; ComponentLink7URL: https://datasheet.octopart.com:443/MFR-25FBF52-1K-Yageo-datasheet-137700554.pdf?src-supplier=Future+Electronics; ComponentLink7Description: https://datasheet.octopart.com:443/MFR-25FBF52-1K-Yageo-datasheet-137700554.pdf?src-supplier=Future+Electronics; ComponentLink8URL: http://sigma.octopart.com:80/conflict_mineral_statement/Yageo-company-3.pdf?src-supplier=Compliance+Statements; ComponentLink8Description: http://sigma.octopart.com:80/conflict_mineral_statement/Yageo-company-3.pdf?src-supplier=Compliance+Statements; ComponentLink9URL: http://sigma.octopart.com:80/rohs_statement/Yageo-company-2.pdf?src-supplier=Compliance+Statements; ComponentLink9Description: http://sigma.octopart.com:80/rohs_statement/Yageo-company-2.pdf?src-supplier=Compliance+Statements
U1 = TDA2030A: Amplifier IC 1-Channel (Mono) Class AB 5-PENTAWATT; MF: STMicroelectronics; SnapEDA_Link: https://www.snapeda.com/parts/TDA2030A/STMicroelectronics/view-part/?ref=snap; Package: Pentawatt-5 STMicroelectronics; Value: *; MP: TDA2030A; Check_prices: https://www.snapeda.com/parts/TDA2030A/STMicroelectronics/view-part/?ref=eda
U2 U3 = NE5532: Dual Low-Noise Operational Amplifier, 10 to 30 V, 0 to 70 degC, 8-pin DIP (P8), Pb-Free (RoHS); Manufacturer: Texas Instruments; Vn at 1kHz(Typ)(nV/rtHz): 5; Vio (25C)(Max)(mV): 4; CMRR(Min)(dB): 70; Total Supply Voltage(Min)(+5V is 5, +/-5V is 10): 10; Total Supply Voltage(Max)(+5V is 5, +/-5V is 10): 30; Slew Rate(Typ)(V/us): 9; IIB(Max)(pA): 800000; Number of Channels: 2; Sub Family: General Purpose Amplifier, High Supply Voltage Amplifier (>=30V), Low Noise Amp (<=10nV/rtHz); Eco-Plan: Pb-Free (RoHS); ComponentLink2Description: Datasheet; ComponentLink3URL: http://www.ti.com/litv/pdf/mpdi001b; ComponentLink1URL: http://www.ti.com/; Mounting Technology: Through Hole; ComponentLink1Description: Manufacturer URL; PackageReference: P0008A; DatasheetVersion: SLOS075I; Iq per channel(Max)(mA): 4; ComponentLink2URL: http://www.ti.com/lit/ds/symlink/ne5532a.pdf; PackageDescription: 8-Pin Plastic In-Line, Body 9.59 x 6.35 mm, Pitch 2.54 mm; GBW(Typ)(MHz): 10; ComponentLink3Description: Package Specification; PackageVersion: 4040082/E, 04/2010; Code_JEDEC: MS-001; PartNumber: NE5532AP